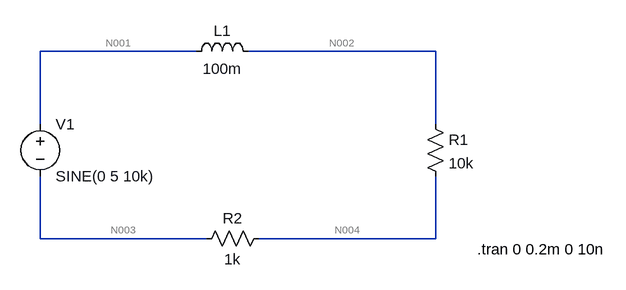
[diagram p0: schematic Draft1.asc]
Draft1.asc, the LTspice schematic file:
Version 4.1
SHEET 1 968 680
WIRE 320 32 80 32
WIRE 688 32 400 32
WIRE 80 144 80 32
WIRE 688 144 688 32
WIRE 80 320 80 224
WIRE 336 320 80 320
WIRE 688 320 688 224
WIRE 688 320 416 320
SYMBOL voltage 80 128 R0
WINDOW 123 0 0 Left 0
WINDOW 39 0 0 Left 0
SYMATTR InstName V1
SYMATTR Value SINE(0 5 10k)
SYMBOL ind 304 48 R270
WINDOW 0 32 56 VTop 2
WINDOW 3 5 56 VBottom 2
SYMATTR InstName L1
SYMATTR Value 100m
SYMATTR SpiceLine Rser=1m
SYMBOL res 672 128 R0
SYMATTR InstName R1
SYMATTR Value 10k
SYMBOL res 432 304 R90
WINDOW 0 0 56 VBottom 2
WINDOW 3 32 56 VTop 2
SYMATTR InstName R2
SYMATTR Value 1k
TEXT 752 336 Left 2 !.tran 0 0.2m 0 10n

The netlist it stands for:
* Draft1.asc
V1 N001 N003 SINE(0 5 10k)
L1 N001 N002 100m Rser=1m
R1 N002 N004 10k
R2 N004 N003 1k
.tran 0 0.2m 0 10n
.backanno
.end

* Results of the author's LTspice run, read from the files saved beside the schematic
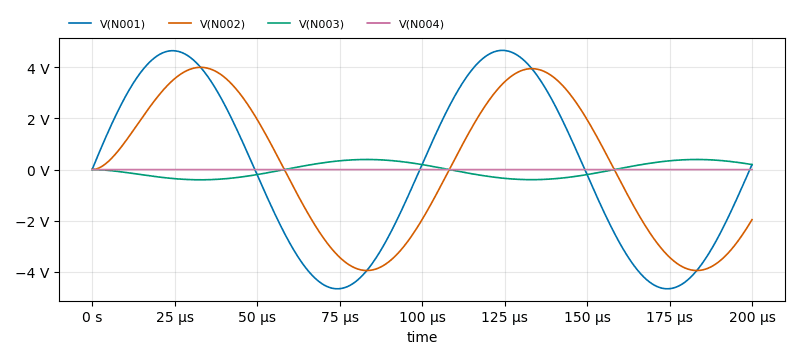
[diagram p1: Transient Analysis of Draft1.asc, plotted from the saved traces]
* Transient Analysis, 1 run:
*   V(N001): min -4.661 V, max 4.661 V, average -8.898 mV, rms 3.29 V, last 195.8 mV
*   V(N002): min -3.947 V, max 3.998 V, average 88.98 mV, rms 2.806 V, last -1.958 V
*   V(N003): min -399.8 mV, max 394.7 mV, average -8.898 mV, rms 280.6 mV, last 195.8 mV
*   V(N004): min -98.32 nV, max 98.46 nV, average 770.5 pV, rms 30.8 nV, last -17.89 nV